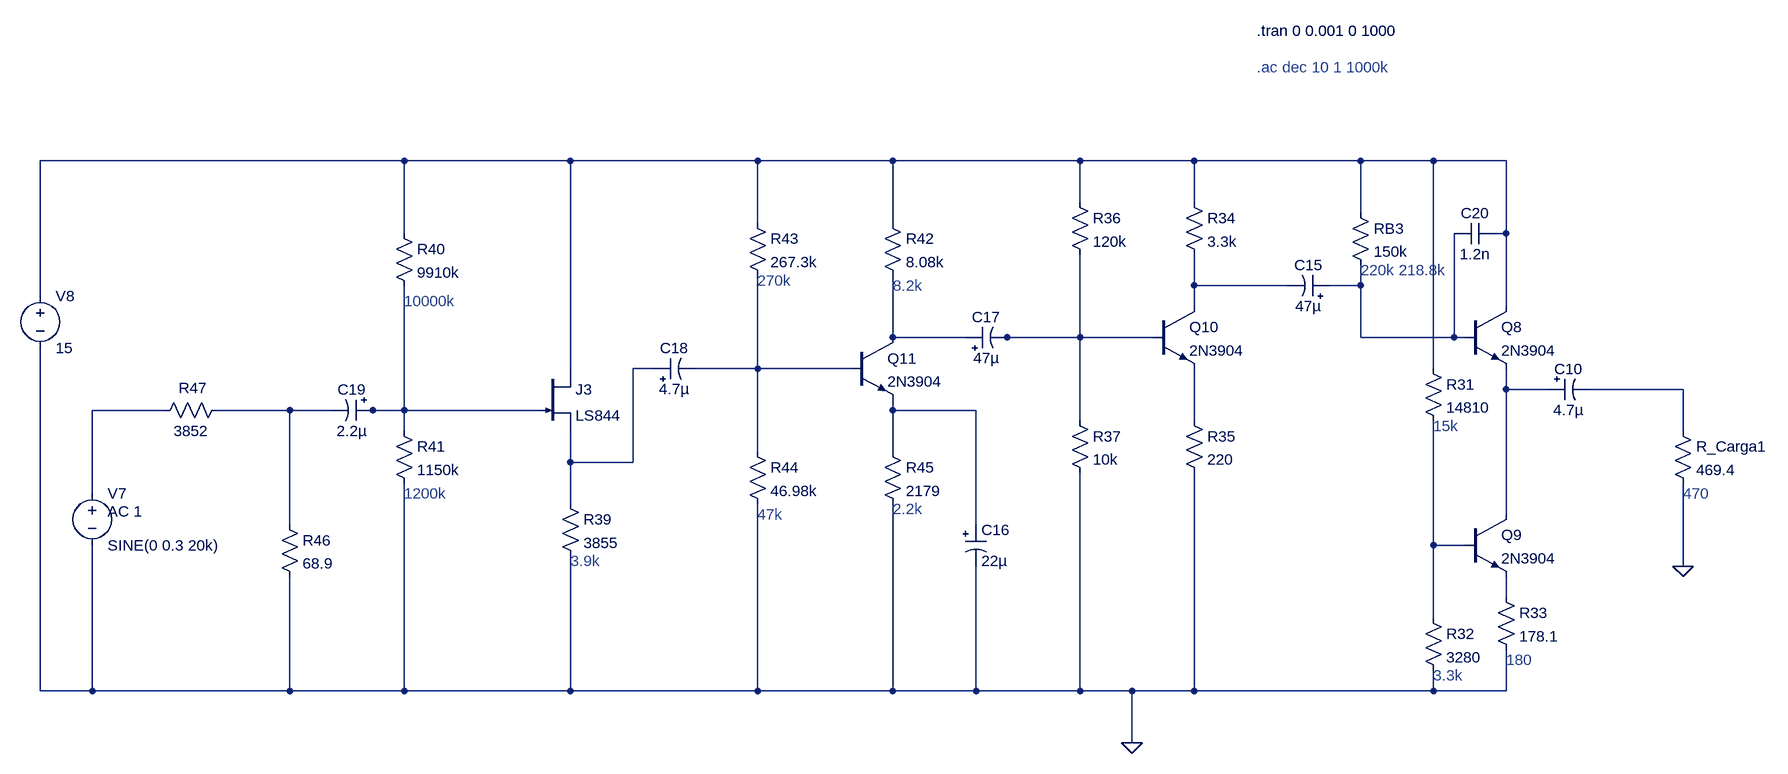
[diagram p0: schematic Clase_A.asc]
Clase_A.asc, the LTspice schematic file:
Version 4.1
SHEET 1 880 804
WIRE -4928 -1136 -5488 -1136
WIRE -4672 -1136 -4928 -1136
WIRE -4384 -1136 -4672 -1136
WIRE -4176 -1136 -4384 -1136
WIRE -3888 -1136 -4176 -1136
WIRE -3712 -1136 -3888 -1136
WIRE -3456 -1136 -3712 -1136
WIRE -3344 -1136 -3456 -1136
WIRE -3232 -1136 -3344 -1136
WIRE -3888 -1072 -3888 -1136
WIRE -3712 -1072 -3712 -1136
WIRE -3456 -1056 -3456 -1136
WIRE -4384 -1040 -4384 -1136
WIRE -4176 -1040 -4176 -1136
WIRE -4928 -1024 -4928 -1136
WIRE -3232 -1024 -3232 -1136
WIRE -3232 -1024 -3248 -1024
WIRE -3712 -944 -3712 -992
WIRE -3568 -944 -3712 -944
WIRE -3456 -944 -3456 -976
WIRE -3456 -944 -3504 -944
WIRE -5488 -928 -5488 -1136
WIRE -3712 -912 -3712 -944
WIRE -3232 -912 -3232 -1024
WIRE -4176 -864 -4176 -960
WIRE -4064 -864 -4176 -864
WIRE -4000 -864 -4016 -864
WIRE -3888 -864 -3888 -992
WIRE -3888 -864 -4000 -864
WIRE -3776 -864 -3888 -864
WIRE -3456 -864 -3456 -944
WIRE -3312 -864 -3312 -1024
WIRE -3312 -864 -3456 -864
WIRE -3296 -864 -3312 -864
WIRE -4672 -816 -4672 -1136
WIRE -4544 -816 -4576 -816
WIRE -4384 -816 -4384 -960
WIRE -4384 -816 -4480 -816
WIRE -4240 -816 -4384 -816
WIRE -3344 -816 -3344 -1136
WIRE -3232 -784 -3232 -816
WIRE -3168 -784 -3232 -784
WIRE -2960 -784 -3104 -784
WIRE -5296 -752 -5408 -752
WIRE -5104 -752 -5216 -752
WIRE -5040 -752 -5104 -752
WIRE -4976 -752 -4992 -752
WIRE -4928 -752 -4928 -944
WIRE -4928 -752 -4976 -752
WIRE -4720 -752 -4928 -752
WIRE -4176 -752 -4176 -768
WIRE -4048 -752 -4176 -752
WIRE -3888 -736 -3888 -864
WIRE -3712 -736 -3712 -816
WIRE -4928 -720 -4928 -752
WIRE -2960 -720 -2960 -784
WIRE -4384 -688 -4384 -816
WIRE -4176 -688 -4176 -752
WIRE -4672 -672 -4672 -720
WIRE -4576 -672 -4576 -816
WIRE -4576 -672 -4672 -672
WIRE -5408 -624 -5408 -752
WIRE -4672 -608 -4672 -672
WIRE -3232 -592 -3232 -784
WIRE -5104 -576 -5104 -752
WIRE -4048 -576 -4048 -752
WIRE -3344 -544 -3344 -736
WIRE -3296 -544 -3344 -544
WIRE -2960 -512 -2960 -640
WIRE -3232 -464 -3232 -496
WIRE -3344 -432 -3344 -544
WIRE -5488 -320 -5488 -848
WIRE -5408 -320 -5408 -544
WIRE -5408 -320 -5488 -320
WIRE -5104 -320 -5104 -496
WIRE -5104 -320 -5408 -320
WIRE -4928 -320 -4928 -640
WIRE -4928 -320 -5104 -320
WIRE -4672 -320 -4672 -528
WIRE -4672 -320 -4928 -320
WIRE -4384 -320 -4384 -608
WIRE -4384 -320 -4672 -320
WIRE -4176 -320 -4176 -608
WIRE -4176 -320 -4384 -320
WIRE -4048 -320 -4048 -512
WIRE -4048 -320 -4176 -320
WIRE -3888 -320 -3888 -656
WIRE -3888 -320 -4048 -320
WIRE -3808 -320 -3888 -320
WIRE -3712 -320 -3712 -656
WIRE -3712 -320 -3808 -320
WIRE -3344 -320 -3344 -352
WIRE -3344 -320 -3712 -320
WIRE -3232 -320 -3232 -384
WIRE -3232 -320 -3344 -320
WIRE -3808 -240 -3808 -320
FLAG -2960 -512 0
FLAG -3808 -240 0
SYMBOL npn -3296 -912 R0
SYMATTR InstName Q8
SYMATTR Value 2N3904
SYMBOL res -3472 -1072 R0
SYMATTR InstName RB3
SYMATTR Value 150k
SYMBOL res -2976 -736 R0
SYMATTR InstName R_Carga1
SYMATTR Value 469.4
SYMBOL npn -3296 -592 R0
SYMATTR InstName Q9
SYMATTR Value 2N3904
SYMBOL res -3360 -832 R0
SYMATTR InstName R31
SYMATTR Value 14810
SYMBOL res -3360 -448 R0
SYMATTR InstName R32
SYMATTR Value 3280
SYMBOL res -3248 -480 R0
SYMATTR InstName R33
SYMATTR Value 178.1
SYMBOL npn -3776 -912 R0
SYMATTR InstName Q10
SYMATTR Value 2N3904
SYMBOL res -3728 -1088 R0
SYMATTR InstName R34
SYMATTR Value 3.3k
SYMBOL res -3728 -752 R0
SYMATTR InstName R35
SYMATTR Value 220
SYMBOL res -3904 -1088 R0
SYMATTR InstName R36
SYMATTR Value 120k
SYMBOL res -3904 -752 R0
SYMATTR InstName R37
SYMATTR Value 10k
SYMBOL njf -4720 -816 R0
SYMATTR InstName J3
SYMATTR Value LS844
SYMBOL res -4688 -624 R0
SYMATTR InstName R39
SYMATTR Value 3855
SYMBOL res -4944 -1040 R0
SYMATTR InstName R40
SYMATTR Value 9910k
SYMBOL res -4944 -736 R0
SYMATTR InstName R41
SYMATTR Value 1150k
SYMBOL voltage -5408 -640 R0
WINDOW 123 24 44 Left 2
WINDOW 39 0 0 Left 0
SYMATTR Value2 AC 1
SYMATTR InstName V7
SYMATTR Value SINE(0 0.3 20k)
SYMBOL voltage -5488 -944 R0
SYMATTR InstName V8
SYMATTR Value 15
SYMBOL polcap -3168 -800 M90
WINDOW 0 0 32 VBottom 2
WINDOW 3 32 32 VTop 2
SYMATTR InstName C10
SYMATTR Value 4.7µ
SYMBOL polcap -3504 -928 M270
WINDOW 0 32 32 VTop 2
WINDOW 3 0 32 VBottom 2
SYMATTR InstName C15
SYMATTR Value 47µ
SYMBOL npn -4240 -864 R0
SYMATTR InstName Q11
SYMATTR Value 2N3904
SYMBOL res -4192 -1056 R0
SYMATTR InstName R42
SYMATTR Value 8.08k
SYMBOL res -4400 -1056 R0
SYMATTR InstName R43
SYMATTR Value 267.3k
SYMBOL res -4400 -704 R0
SYMATTR InstName R44
SYMATTR Value 46.98k
SYMBOL res -4192 -704 R0
SYMATTR InstName R45
SYMATTR Value 2179
SYMBOL polcap -4064 -576 R0
SYMATTR InstName C16
SYMATTR Value 22µ
SYMBOL polcap -4064 -848 R270
WINDOW 0 32 32 VTop 2
WINDOW 3 0 32 VBottom 2
SYMATTR InstName C17
SYMATTR Value 47µ
SYMBOL polcap -4544 -800 R270
WINDOW 0 32 32 VTop 2
WINDOW 3 0 32 VBottom 2
SYMATTR InstName C18
SYMATTR Value 4.7µ
SYMBOL polcap -4976 -768 R90
WINDOW 0 0 32 VBottom 2
WINDOW 3 32 32 VTop 2
SYMATTR InstName C19
SYMATTR Value 2.2µ
SYMBOL res -5120 -592 R0
SYMATTR InstName R46
SYMATTR Value 68.9
SYMBOL res -5200 -768 R90
WINDOW 0 -3 53 VBottom 2
WINDOW 3 32 56 VTop 2
SYMATTR InstName R47
SYMATTR Value 3852
SYMBOL cap -3248 -1040 R90
WINDOW 0 0 32 VBottom 2
WINDOW 3 32 32 VTop 2
SYMATTR InstName C20
SYMATTR Value 1.2n
TEXT -3616 -1336 Left 2 !.tran 0 0.001 0 1000
TEXT -3616 -1280 Left 2 ;.ac dec 10 1 1000k
TEXT -3344 -728 Left 2 ;15k
TEXT -3344 -344 Left 2 ;3.3k
TEXT -3232 -368 Left 2 ;180
TEXT -2960 -624 Left 2 ;470
TEXT -3456 -968 Left 2 ;220k 218.8k
TEXT -4176 -600 Left 2 ;2.2k
TEXT -4384 -952 Left 2 ;270k
TEXT -4384 -592 Left 2 ;47k
TEXT -4176 -944 Left 2 ;8.2k
TEXT -4928 -920 Left 2 ;10000k
TEXT -4928 -624 Left 2 ;1200k
TEXT -4672 -520 Left 2 ;3.9k

The netlist it stands for:
* Clase_A.asc
Q8 N001 N003 N008 0 2N3904
RB3 N001 N003 150k
R_Carga1 N009 0 469.4
Q9 N008 N015 N016 0 2N3904
R31 N001 N015 14810
R32 N015 0 3280
R33 N016 0 178.1
Q10 N002 N005 N014 0 2N3904
R34 N001 N002 3.3k
R35 N014 0 220
R36 N001 N005 120k
R37 N005 0 10k
J3 N001 N012 N006 LS844
R39 N006 0 3855
R40 N001 N012 9910k
R41 N012 0 1150k
V7 N010 0 SINE(0 0.3 20k) AC 1
V8 N001 0 15
C10 N008 N009 4.7µ
C15 N003 N002 47µ
Q11 N004 N007 N013 0 2N3904
R42 N001 N004 8.08k
R43 N001 N007 267.3k
R44 N007 0 46.98k
R45 N013 0 2179
C16 N013 0 22µ
C17 N004 N005 47µ
C18 N006 N007 4.7µ
C19 N012 N011 2.2µ
R46 N011 0 68.9
R47 N011 N010 3852
C20 N001 N003 1.2n
.model NPN NPN
.model PNP PNP
.lib standard.bjt
.model NJF NJF
.model PJF PJF
.lib standard.jft
.tran 0 0.001 0 1000
* .ac dec 10 1 1000k
* 15k
* 3.3k
* 180
* 470
* 220k 218.8k
* 2.2k
* 270k
* 47k
* 8.2k
* 10000k
* 1200k
* 3.9k
.backanno
.end